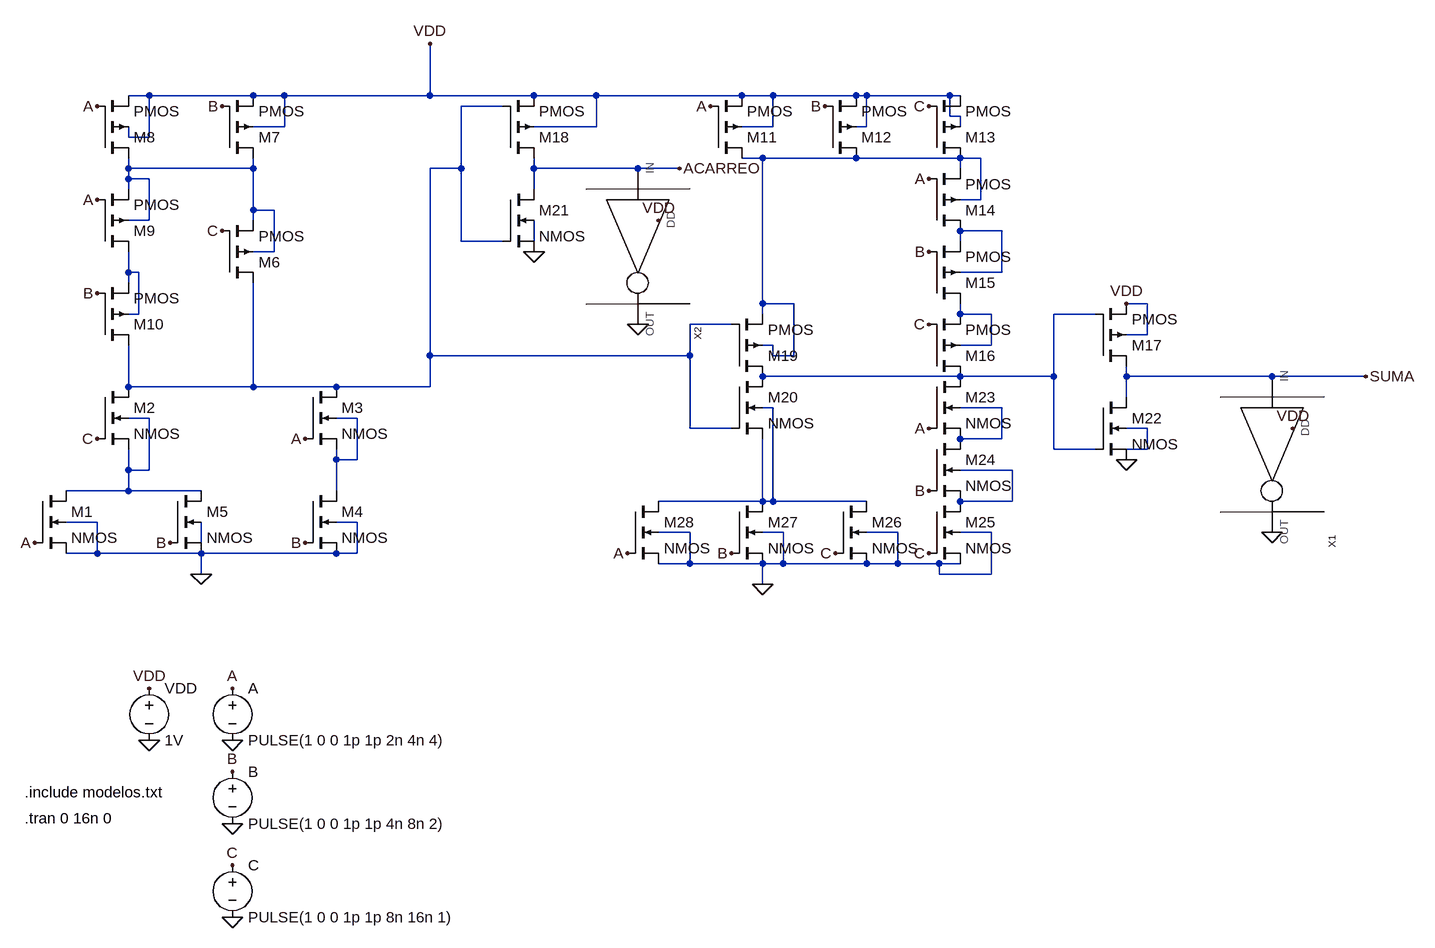
[diagram p0: schematic 3.1.asc]
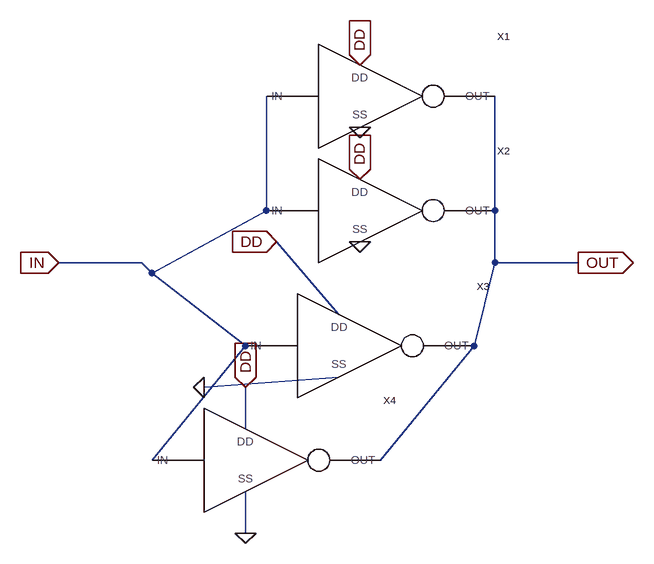
[diagram p1: sub-circuit udcarga.asc]
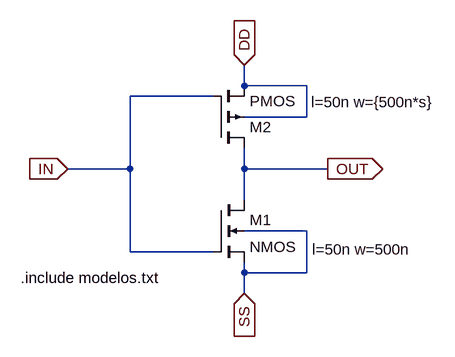
[diagram p2: sub-circuit inversorp.asc]
3.1.asc, the LTspice schematic file:
Version 4
SHEET 1 2568 840
WIRE 272 -464 240 -464
WIRE 432 -464 272 -464
WIRE 480 -464 432 -464
WIRE 704 -464 704 -544
WIRE 704 -464 480 -464
WIRE 864 -464 704 -464
WIRE 960 -464 864 -464
WIRE 1184 -464 960 -464
WIRE 1232 -464 1184 -464
WIRE 1360 -464 1232 -464
WIRE 1376 -464 1360 -464
WIRE 1504 -464 1376 -464
WIRE 1520 -464 1504 -464
WIRE 816 -448 752 -448
WIRE 1504 -432 1504 -464
WIRE 1520 -432 1504 -432
WIRE 480 -416 480 -464
WIRE 480 -416 432 -416
WIRE 960 -416 960 -464
WIRE 960 -416 864 -416
WIRE 1232 -416 1232 -464
WIRE 1232 -416 1184 -416
WIRE 1376 -416 1376 -464
WIRE 1376 -416 1360 -416
WIRE 1520 -416 1520 -432
WIRE 240 -400 240 -416
WIRE 272 -400 272 -464
WIRE 272 -400 240 -400
WIRE 1216 -368 1184 -368
WIRE 1360 -368 1216 -368
WIRE 1520 -368 1360 -368
WIRE 1552 -368 1520 -368
WIRE 240 -352 240 -368
WIRE 432 -352 432 -368
WIRE 432 -352 240 -352
WIRE 752 -352 752 -448
WIRE 752 -352 704 -352
WIRE 864 -352 864 -368
WIRE 1024 -352 864 -352
WIRE 1088 -352 1024 -352
WIRE 1520 -352 1520 -368
WIRE 240 -336 240 -352
WIRE 272 -336 240 -336
WIRE 240 -320 240 -336
WIRE 864 -320 864 -352
WIRE 1552 -304 1552 -368
WIRE 1552 -304 1520 -304
WIRE 432 -288 432 -352
WIRE 464 -288 432 -288
WIRE 272 -272 272 -336
WIRE 272 -272 240 -272
WIRE 432 -272 432 -288
WIRE 1584 -256 1520 -256
WIRE 752 -240 752 -352
WIRE 816 -240 752 -240
WIRE 864 -240 864 -272
WIRE 1520 -240 1520 -256
WIRE 464 -224 464 -288
WIRE 464 -224 432 -224
WIRE 240 -192 240 -224
WIRE 256 -192 240 -192
WIRE 1584 -192 1584 -256
WIRE 1584 -192 1520 -192
WIRE 240 -176 240 -192
WIRE 1216 -144 1216 -368
WIRE 1264 -144 1216 -144
WIRE 1808 -144 1776 -144
WIRE 256 -128 256 -192
WIRE 256 -128 240 -128
WIRE 1216 -128 1216 -144
WIRE 1520 -128 1520 -144
WIRE 1568 -128 1520 -128
WIRE 1728 -128 1664 -128
WIRE 1168 -112 1104 -112
WIRE 1808 -96 1808 -144
WIRE 1808 -96 1776 -96
WIRE 1232 -80 1216 -80
WIRE 1568 -80 1568 -128
WIRE 1568 -80 1520 -80
WIRE 704 -64 704 -352
WIRE 1104 -64 1104 -112
WIRE 1104 -64 704 -64
WIRE 1232 -64 1232 -80
WIRE 1264 -64 1264 -144
WIRE 1264 -64 1232 -64
WIRE 1520 -32 1216 -32
WIRE 1664 -32 1664 -128
WIRE 1664 -32 1520 -32
WIRE 1776 -32 1776 -48
WIRE 2000 -32 1776 -32
WIRE 2144 -32 2000 -32
WIRE 240 -16 240 -80
WIRE 432 -16 432 -176
WIRE 432 -16 240 -16
WIRE 560 -16 432 -16
WIRE 704 -16 704 -64
WIRE 704 -16 560 -16
WIRE 1776 0 1776 -32
WIRE 1232 16 1216 16
WIRE 1584 16 1520 16
WIRE 272 32 240 32
WIRE 592 32 560 32
WIRE 1104 48 1104 -64
WIRE 1168 48 1104 48
WIRE 1808 48 1776 48
WIRE 1584 64 1584 16
WIRE 1584 64 1520 64
WIRE 1664 80 1664 -32
WIRE 1728 80 1664 80
WIRE 1808 80 1808 48
WIRE 1808 80 1776 80
WIRE 560 96 560 80
WIRE 592 96 592 32
WIRE 592 96 560 96
WIRE 1776 96 1776 80
WIRE 240 112 240 80
WIRE 272 112 272 32
WIRE 272 112 240 112
WIRE 1600 112 1520 112
WIRE 240 144 240 112
WIRE 240 144 144 144
WIRE 352 144 240 144
WIRE 560 144 560 96
WIRE 1216 160 1216 64
WIRE 1216 160 1056 160
WIRE 1232 160 1232 16
WIRE 1232 160 1216 160
WIRE 1376 160 1232 160
WIRE 1600 160 1600 112
WIRE 1600 160 1520 160
WIRE 192 192 144 192
WIRE 592 192 560 192
WIRE 1104 208 1056 208
WIRE 1248 208 1216 208
WIRE 1424 208 1376 208
WIRE 1568 208 1520 208
WIRE 352 224 352 192
WIRE 192 240 192 192
WIRE 192 240 144 240
WIRE 352 240 192 240
WIRE 560 240 352 240
WIRE 592 240 592 192
WIRE 592 240 560 240
WIRE 1104 256 1104 208
WIRE 1104 256 1056 256
WIRE 1216 256 1104 256
WIRE 1248 256 1248 208
WIRE 1248 256 1216 256
WIRE 1376 256 1248 256
WIRE 1424 256 1424 208
WIRE 1424 256 1376 256
WIRE 1488 256 1424 256
WIRE 1520 256 1488 256
WIRE 352 272 352 240
WIRE 1488 272 1488 256
WIRE 1568 272 1568 208
WIRE 1568 272 1488 272
WIRE 1216 288 1216 256
FLAG 96 224 A
FLAG 304 224 B
FLAG 352 272 0
FLAG 512 224 B
FLAG 512 64 A
FLAG 192 64 C
FLAG 192 -448 A
FLAG 192 -304 A
FLAG 192 -160 B
FLAG 384 -448 B
FLAG 384 -256 C
FLAG 1088 -352 ACARREO
FLAG 704 -544 VDD
FLAG 864 -224 0
FLAG 1136 -448 A
FLAG 1312 -448 B
FLAG 1472 -448 C
FLAG 1472 -336 A
FLAG 1472 -224 B
FLAG 1472 -112 C
FLAG 1216 288 0
FLAG 1008 240 A
FLAG 1472 48 A
FLAG 1168 240 B
FLAG 1472 144 B
FLAG 1328 240 C
FLAG 1472 240 C
FLAG 1776 96 0
FLAG 1776 -144 VDD
FLAG 2144 -32 SUMA
FLAG 272 528 0
FLAG 400 528 0
FLAG 400 656 0
FLAG 400 800 0
FLAG 272 448 VDD
FLAG 400 448 A
FLAG 400 576 B
FLAG 400 720 C
FLAG 1024 -112 0
FLAG 2000 208 0
FLAG 1056 -272 VDD
FLAG 2032 48 VDD
SYMBOL voltage 272 432 R0
WINDOW 123 0 0 Left 0
WINDOW 39 0 0 Left 0
SYMATTR InstName VDD
SYMATTR Value 1V
SYMBOL voltage 400 432 R0
WINDOW 123 0 0 Left 0
WINDOW 39 0 0 Left 0
SYMATTR InstName A
SYMATTR Value PULSE(1 0 0 1p 1p 2n 4n 4)
SYMBOL voltage 400 560 R0
WINDOW 123 0 0 Left 0
WINDOW 39 0 0 Left 0
SYMATTR InstName B
SYMATTR Value PULSE(1 0 0 1p 1p 4n 8n 2)
SYMBOL voltage 400 704 R0
WINDOW 123 0 0 Left 0
WINDOW 39 0 0 Left 0
SYMATTR InstName C
SYMATTR Value PULSE(1 0 0 1p 1p 8n 16n 1)
SYMBOL nmos4 96 144 R0
SYMATTR InstName M1
SYMATTR Value2 l=50n w=1000n
SYMBOL nmos4 192 -16 R0
SYMATTR InstName M2
SYMATTR Value2 l=50n w=1000n
SYMBOL nmos4 512 -16 R0
SYMATTR InstName M3
SYMATTR Value2 l=50n w=1000n
SYMBOL nmos4 512 144 R0
SYMATTR InstName M4
SYMATTR Value2 l=50n w=1000n
SYMBOL nmos4 304 144 R0
SYMATTR InstName M5
SYMATTR Value2 l=50n w=1000n
SYMBOL pmos4 384 -176 M180
SYMATTR InstName M6
SYMATTR Value2 l=50n w=1500n
SYMBOL pmos4 384 -368 M180
SYMATTR InstName M7
SYMATTR Value2 l=50n w=3000n
SYMBOL pmos4 192 -368 M180
SYMATTR InstName M8
SYMATTR Value2 l=50n w=3000n
SYMBOL pmos4 192 -224 M180
SYMATTR InstName M9
SYMATTR Value2 l=50n w=3000n
SYMBOL pmos4 192 -80 M180
SYMATTR InstName M10
SYMATTR Value2 l=50n w=3000n
SYMBOL pmos4 1136 -368 M180
SYMATTR InstName M11
SYMATTR Value2 l=50n w=4000n
SYMBOL pmos4 1312 -368 M180
SYMATTR InstName M12
SYMATTR Value2 l=50n w=4000n
SYMBOL pmos4 1472 -368 M180
SYMATTR InstName M13
SYMATTR Value2 l=50n w=4000n
SYMBOL pmos4 1472 -256 M180
SYMATTR InstName M14
SYMATTR Value2 l=50n w=4000n
SYMBOL pmos4 1472 -144 M180
SYMATTR InstName M15
SYMATTR Value2 l=50n w=4000n
SYMBOL pmos4 1472 -32 M180
SYMATTR InstName M16
SYMATTR Value2 l=50n w=4000n
SYMBOL pmos4 1728 -48 M180
SYMATTR InstName M17
SYMATTR Value2 l=50n w=1000n
SYMBOL pmos4 816 -368 M180
SYMATTR InstName M18
SYMATTR Value2 l=50n w=1000n
SYMBOL pmos4 1168 -32 M180
SYMATTR InstName M19
SYMATTR Value2 l=50n w=1500n
SYMBOL nmos4 1168 -32 R0
SYMATTR InstName M20
SYMATTR Value2 l=50n w=1000n
SYMBOL nmos4 816 -320 R0
SYMATTR InstName M21
SYMATTR Value2 l=50n w=500n
SYMBOL nmos4 1728 0 R0
SYMATTR InstName M22
SYMATTR Value2 l=50n w=500n
SYMBOL nmos4 1472 -32 R0
SYMATTR InstName M23
SYMATTR Value2 l=50n w=1500n
SYMBOL nmos4 1472 64 R0
SYMATTR InstName M24
SYMATTR Value2 l=50n w=1500n
SYMBOL nmos4 1472 160 R0
SYMATTR InstName M25
SYMATTR Value2 l=50n w=1500n
SYMBOL nmos4 1328 160 R0
SYMATTR InstName M26
SYMATTR Value2 l=50n w=1000n
SYMBOL nmos4 1168 160 R0
SYMATTR InstName M27
SYMATTR Value2 l=50n w=1000n
SYMBOL nmos4 1008 160 R0
SYMATTR InstName M28
SYMATTR Value2 l=50n w=1000n
SYMBOL udcarga 2000 48 R90
SYMATTR InstName X1
SYMBOL udcarga 1024 -272 R90
SYMATTR InstName X2
TEXT 80 608 Left 2 !.include modelos.txt
TEXT 80 648 Left 2 !.tran 0 16n 0

udcarga.asc, the sub-circuit schematic file:
Version 4
SHEET 1 880 820
WIRE -16 304 -16 128
WIRE 336 304 336 128
WIRE -208 384 -336 384
WIRE 336 384 336 304
WIRE 464 384 336 384
WIRE -192 400 -16 304
WIRE -192 400 -208 384
WIRE 96 464 0 352
WIRE -48 512 -192 400
WIRE 304 512 336 384
WIRE -112 576 96 560
WIRE -48 640 -48 576
WIRE -192 688 -48 512
WIRE 160 688 304 512
WIRE -48 800 -48 736
FLAG 464 384 OUT
IOPIN 464 384 Out
FLAG -336 384 IN
IOPIN -336 384 In
FLAG 128 80 DD
IOPIN 128 80 In
FLAG 128 256 DD
IOPIN 128 256 In
FLAG 0 352 DD
IOPIN 0 352 In
FLAG -48 576 DD
IOPIN -48 576 In
FLAG 128 176 0
FLAG 128 352 0
FLAG -112 576 0
FLAG -48 800 0
SYMBOL inversorp 64 128 R0
SYMATTR InstName X1
SYMBOL inversorp 64 304 R0
SYMATTR InstName X2
SYMBOL inversorp 32 512 R0
SYMATTR InstName X3
SYMBOL inversorp -112 688 R0
SYMATTR InstName X4

inversorp.asc, the sub-circuit schematic file:
Version 4
SHEET 1 1048 680
WIRE 112 32 112 0
WIRE 208 32 112 32
WIRE 64 48 -64 48
WIRE 208 80 208 32
WIRE 208 80 112 80
WIRE -64 160 -64 48
WIRE -64 160 -160 160
WIRE 112 160 112 128
WIRE 240 160 112 160
WIRE 112 208 112 160
WIRE 208 256 112 256
WIRE -64 288 -64 160
WIRE 64 288 -64 288
WIRE 112 320 112 304
WIRE 208 320 208 256
WIRE 208 320 112 320
WIRE 112 352 112 320
FLAG 112 0 DD
IOPIN 112 0 In
FLAG -160 160 IN
IOPIN -160 160 In
FLAG 240 160 OUT
IOPIN 240 160 Out
FLAG 112 352 SS
IOPIN 112 352 In
SYMBOL nmos4 64 208 R0
WINDOW 123 152 76 Left 2
WINDOW 0 56 31 Left 2
SYMATTR Value2 l=50n w=500n
SYMATTR InstName M1
SYMBOL pmos4 64 128 M180
WINDOW 123 151 71 Left 2
SYMATTR Value2 l=50n w={500n*s}
SYMATTR InstName M2
TEXT -232 328 Left 2 !.include modelos.txt

The netlist it stands for:
* 3.1.asc
VDD VDD 0 1V
V§A A 0 PULSE(1 0 0 1p 1p 2n 4n 4)
V§B B 0 PULSE(1 0 0 1p 1p 4n 8n 2)
V§C C 0 PULSE(1 0 0 1p 1p 8n 16n 1)
M1 N011 A 0 0 NMOS l=50n w=1000n
M2 N001 C N011 N011 NMOS l=50n w=1000n
M3 N001 A N012 N012 NMOS l=50n w=1000n
M4 N012 B 0 0 NMOS l=50n w=1000n
M5 N011 B 0 N014 NMOS l=50n w=1000n
M6 N001 C N003 N003 PMOS l=50n w=1500n
M7 N003 B VDD VDD PMOS l=50n w=3000n
M8 N003 A VDD VDD PMOS l=50n w=3000n
M9 N006 A N003 N003 PMOS l=50n w=3000n
M10 N001 B N006 N006 PMOS l=50n w=3000n
M11 N002 A VDD VDD PMOS l=50n w=4000n
M12 N002 B VDD VDD PMOS l=50n w=4000n
M13 N002 C VDD VDD PMOS l=50n w=4000n
M14 N004 A N002 N002 PMOS l=50n w=4000n
M15 N007 B N004 N004 PMOS l=50n w=4000n
M16 N008 C N007 N007 PMOS l=50n w=4000n
M17 SUMA N008 VDD VDD PMOS l=50n w=1000n
M18 ACARREO N001 VDD VDD PMOS l=50n w=1000n
M19 N008 N001 N002 N002 PMOS l=50n w=1500n
M20 N008 N001 N009 N009 NMOS l=50n w=1000n
M21 ACARREO N001 0 N005 NMOS l=50n w=500n
M22 SUMA N008 0 0 NMOS l=50n w=500n
M23 N008 A N010 N010 NMOS l=50n w=1500n
M24 N010 B N013 N013 NMOS l=50n w=1500n
M25 N013 C 0 0 NMOS l=50n w=1500n
M26 N009 C 0 0 NMOS l=50n w=1000n
M27 N009 B 0 0 NMOS l=50n w=1000n
M28 N009 A 0 0 NMOS l=50n w=1000n
XX1 0 SUMA VDD udcarga
XX2 0 ACARREO VDD udcarga

* block symbol definitions
.subckt udcarga OUT IN DD
XX1 DD 0 IN OUT inversorp params: s=2
XX2 DD 0 IN OUT inversorp params: s=2
XX3 DD 0 IN OUT inversorp params: s=2
XX4 DD 0 IN OUT inversorp params: s=2
.ends udcarga

.subckt inversorp DD SS IN OUT
M1 OUT IN SS SS NMOS l=50n w=500n
M2 OUT IN DD DD PMOS l=50n w={500n*s}
.include modelos.txt
.ends inversorp

.model NMOS NMOS
.model PMOS PMOS
.lib standard.mos
.include modelos.txt
.tran 0 16n 0
.backanno
.end